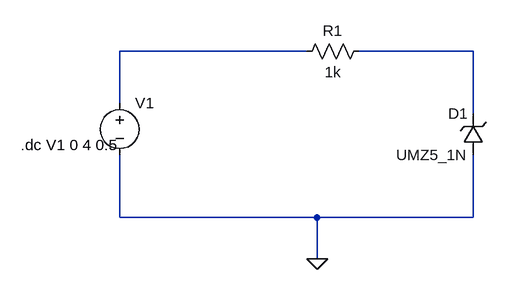
[diagram p0: schematic reverse.asc]
reverse.asc, the LTspice schematic file:
Version 4.1
SHEET 1 880 680
WIRE 352 -16 64 -16
WIRE 608 -16 432 -16
WIRE 64 64 64 -16
WIRE 608 80 608 -16
WIRE 64 240 64 144
WIRE 368 240 64 240
WIRE 608 240 608 144
WIRE 608 240 368 240
WIRE 368 304 368 240
FLAG 368 304 0
SYMBOL voltage 64 48 R0
SYMATTR InstName V1
SYMATTR Value ""
SYMBOL res 448 -32 R90
WINDOW 0 0 56 VBottom 2
WINDOW 3 32 56 VTop 2
SYMATTR InstName R1
SYMATTR Value 1k
SYMBOL zener 624 144 R180
WINDOW 0 24 64 Left 2
WINDOW 3 24 0 Left 2
SYMATTR InstName D1
SYMATTR Value UMZ5_1N
SYMATTR Description Diode
SYMATTR Type diode
TEXT -88 128 Left 2 !.dc V1 0 4 0.5

The netlist it stands for:
* reverse.asc
V1 N001 0
R1 N002 N001 1k
D1 0 N002 UMZ5_1N
.model D D
.lib standard.dio
.dc V1 0 4 0.5
.backanno
.end